# Altium schematic sheet i_O.SchDoc
size A4; SheetNumber: 2; SheetTotal: 4
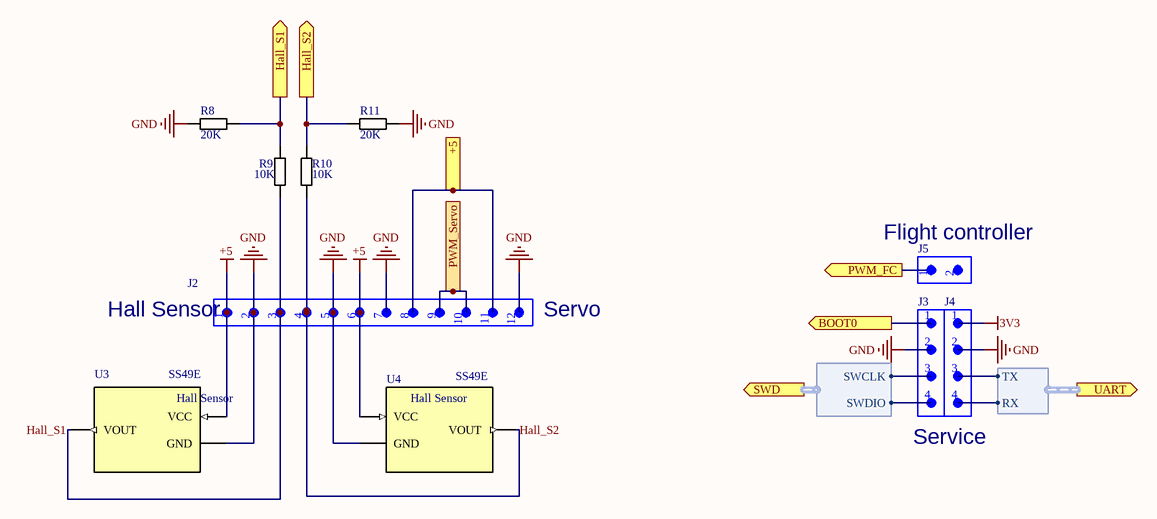
[diagram p0: i_O.SchDoc]

## Parts
J2  Pin_12_Header  [pin_h_12_p2,54mm]  (value not drawn)
J3  Pin_4_Header  [pin_h_4_p2,54mm]  (value not drawn)
J4  Pin_4_Header  [pin_h_4_p2,54mm]  (value not drawn)
J5  2 pin header  [pin_h_2_p2,54mm]  (value not drawn)
R8  20K  [R0603]
R9  10K  [R0603]
R10  10K  [R0603]
R11  20K  [R0603]
U3  SS49E  [SS49E]
U4  SS49E  [SS49E]

## Ports
+5 (in, see Main[2B], Power[3C]), BOOT0 (out, see Main[3C], MCU[2A]), Hall_S1 (out, see Main[3B], MCU[2C]), Hall_S2 (out, see Main[3B], MCU[2C]), PWM_FC (out, see Main[3C], MCU[2C]), PWM_Servo (in, see Main[3C], MCU[2C]), SWD (out, harness SWD, see Main[3C], MCU[3B]), UART (out, harness UART, see Main[3C], MCU[3B])

## Harnesses
UART: RX, TX
SWD: SWDIO, SWCLK

## Nets
3V3: J4.1
+5: J2.1 J2.6 U3.1(VCC) U4.1(VCC)
GND: J2.2 J2.5 J2.7 J2.12 J3.2 J4.2 R8.1 R11.1 U3.2(GND) U4.2(GND)
+5: J2.8 J2.11 ; port +5  [a separate net that carries the same name]
BOOT0: J3.1 ; port BOOT0
Hall_S1: J2.3 R9.1 U3.3(VOUT)
Hall_S1: R8.2 R9.2 ; port Hall_S1  [a separate net that carries the same name]
Hall_S2: J2.4 R10.1 U4.3(VOUT)
Hall_S2: R10.2 R11.2 ; port Hall_S2  [a separate net that carries the same name]
PWM_FC: J5.1 ; port PWM_FC
PWM_Servo: J2.9 J2.10 ; port PWM_Servo
NetJ3_3: J3.3 ; port SWD.SWCLK
NetJ3_4: J3.4 ; port SWD.SWDIO
NetJ4_3: J4.3 ; port UART.TX
NetJ4_4: J4.4 ; port UART.RX

Not connected (* = marked no-connect by the designer): J5 2

## Notes on the sheet
- (near J5) Flight controller
- (near J2) Hall Sensor
- (near J2) Servo
- Service
- (in symbol SS49E) Hall Sensor

## Library data of the parts
J5 = 2 pin header: p.2,54mm; Part Number: 2 pin header; MPN: 2 pin header; Supplier 1: Arduino UA; Supplier Part Number 1: SKV114; Supplier Link 1: https://arduino.ua/ru/prod332-konnektor-40-pin-papa
R8 R11 = R0603 20 kOhm 1% 0,1W 50V: 20 kOhm 1% 0,1W 50V; MPN: RC0603FR-20KR; Power: 0.1W; Tolerance: 0.01; MF: Hitano; Component Link 1 Description: Datasheet; Part Number: R0603 20 kOhm 1% 0,1W 50V; Resistance: 20K; Voltage: 50V; Category: Thick Film Resistor; Supplier 1: rcscomponents; Supplier Part Number 1: 16748; Supplier Link 1: https://www.rcscomponents.kiev.ua/product/20-kohm-1-0-1w-50v-0603-rc0603fr-20kr-hitano-rezystor-smd_16748.html; Component Link 1 URL: https://www.rcscomponents.kiev.ua/datasheets/rc_series_hitano-datasheet.pdf
R9 R10 = R0603 10K 5% 0.1W: 10 kOhm 5% 0,1W 50V; MPN: RC0603JR-0710KL; Power: 0.1W; Tolerance: 0.05; MF: Yageo; Component Link 1 Description: Datasheet; Part Number: R0603 10K 5% 0.1W; Resistance: 10K; Voltage: 50V; Category: Thick Film Resistor; Supplier 1: rcscomponents; Supplier Part Number 1: 107096; Supplier Link 1: https://www.rcscomponents.kiev.ua/product/10-kohm-5-0-1w-50v-0603-rc0603jr-0710kl-yageo_107096.html
U3 = SS49E: TO92; MF: Honeywell; Component Link 1 Description: Datasheet; Supply Voltage: 4.5–6.0 V; Output Voltage: 0.2–4.8 V; Sensitivity: 1.0 mV/G typ.; MPN: SS49E; Supplier 1: Arduino.ua; Supplier Part Number 1: DAT189; Supplier Link 1: https://arduino.ua/ru/prod1474-datchik-holla-ss49e; Component Link 1 URL: https://content.instructables.com/ORIG/FHV/BQO4/JVR5YV9R/FHVBQO4JVR5YV9R.pdf; Part Number: SS49E; Type: Analog
U4 = SS49E: TO92; Supply Voltage: 4.5–6.0 V; Output Voltage: 0.2–4.8 V; Sensitivity: 1.0 mV/G typ.; MF: Honeywell; Component Link 1 Description: Datasheet; Part Number: SS49E; MPN: SS49E; Type: Analog; Supplier 1: Arduino.ua; Supplier Part Number 1: DAT189; Supplier Link 1: https://arduino.ua/ru/prod1474-datchik-holla-ss49e; Component Link 1 URL: https://content.instructables.com/ORIG/FHV/BQO4/JVR5YV9R/FHVBQO4JVR5YV9R.pdf